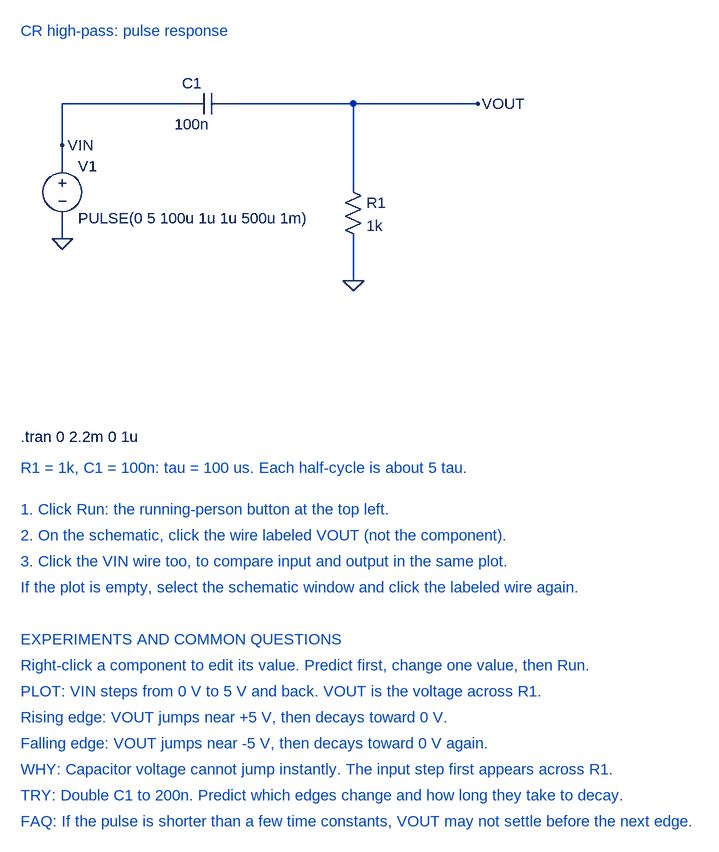
[diagram p0: schematic 13-cr-high-pass-pulse.asc]
13-cr-high-pass-pulse.asc, the LTspice schematic file:
Version 4
SHEET 1 1200 1400
WIRE 128 208 128 240
WIRE 128 320 128 352
WIRE 128 208 128 144
WIRE 128 144 320 144
WIRE 384 144 768 144
WIRE 576 144 576 272
WIRE 576 352 576 416
FLAG 128 208 VIN
FLAG 128 352 0
FLAG 576 416 0
FLAG 768 144 VOUT
SYMBOL voltage 128 224 R0
SYMATTR InstName V1
SYMATTR Value PULSE(0 5 100u 1u 1u 500u 1m)
SYMBOL cap 384 128 R90
WINDOW 0 0 56 VBottom 2
WINDOW 3 32 56 VTop 2
SYMATTR InstName C1
SYMATTR Value 100n
SYMBOL res 560 256 R0
SYMATTR InstName R1
SYMATTR Value 1k
TEXT 64 32 Left 2 ;CR high-pass: pulse response
TEXT 64 656 Left 2 !.tran 0 2.2m 0 1u
TEXT 64 704 Left 2 ;R1 = 1k, C1 = 100n: tau = 100 us. Each half-cycle is about 5 tau.
TEXT 64 768 Left 2 ;1. Click Run: the running-person button at the top left.
TEXT 64 808 Left 2 ;2. On the schematic, click the wire labeled VOUT (not the component).
TEXT 64 848 Left 2 ;3. Click the VIN wire too, to compare input and output in the same plot.
TEXT 64 888 Left 2 ;If the plot is empty, select the schematic window and click the labeled wire again.
TEXT 64 968 Left 2 ;EXPERIMENTS AND COMMON QUESTIONS
TEXT 64 1008 Left 2 ;Right-click a component to edit its value. Predict first, change one value, then Run.
TEXT 64 1048 Left 2 ;PLOT: VIN steps from 0 V to 5 V and back. VOUT is the voltage across R1.
TEXT 64 1088 Left 2 ;Rising edge: VOUT jumps near +5 V, then decays toward 0 V.
TEXT 64 1128 Left 2 ;Falling edge: VOUT jumps near -5 V, then decays toward 0 V again.
TEXT 64 1168 Left 2 ;WHY: Capacitor voltage cannot jump instantly. The input step first appears across R1.
TEXT 64 1208 Left 2 ;TRY: Double C1 to 200n. Predict which edges change and how long they take to decay.
TEXT 64 1248 Left 2 ;FAQ: If the pulse is shorter than a few time constants, VOUT may not settle before the next edge.

The netlist it stands for:
* 13-cr-high-pass-pulse.asc
V1 VIN 0 PULSE(0 5 100u 1u 1u 500u 1m)
C1 VOUT VIN 100n
R1 VOUT 0 1k
* CR high-pass: pulse response
.tran 0 2.2m 0 1u
* R1 = 1k, C1 = 100n: tau = 100 us. Each half-cycle is about 5 tau.
* 1. Click Run: the running-person button at the top left.
* 2. On the schematic, click the wire labeled VOUT (not the component).
* 3. Click the VIN wire too, to compare input and output in the same plot.
* If the plot is empty, select the schematic window and click the labeled wire again.
* EXPERIMENTS AND COMMON QUESTIONS
* Right-click a component to edit its value. Predict first, change one value, then Run.
* PLOT: VIN steps from 0 V to 5 V and back. VOUT is the voltage across R1.
* Rising edge: VOUT jumps near +5 V, then decays toward 0 V.
* Falling edge: VOUT jumps near -5 V, then decays toward 0 V again.
* WHY: Capacitor voltage cannot jump instantly. The input step first appears across R1.
* TRY: Double C1 to 200n. Predict which edges change and how long they take to decay.
* FAQ: If the pulse is shorter than a few time constants, VOUT may not settle before the next edge.
.backanno
.end